# Altium schematic sheet BATTERYMONITORSchDoc.SchDoc
size 300 x 200 mm; SheetNumber: 3; SheetTotal: 4
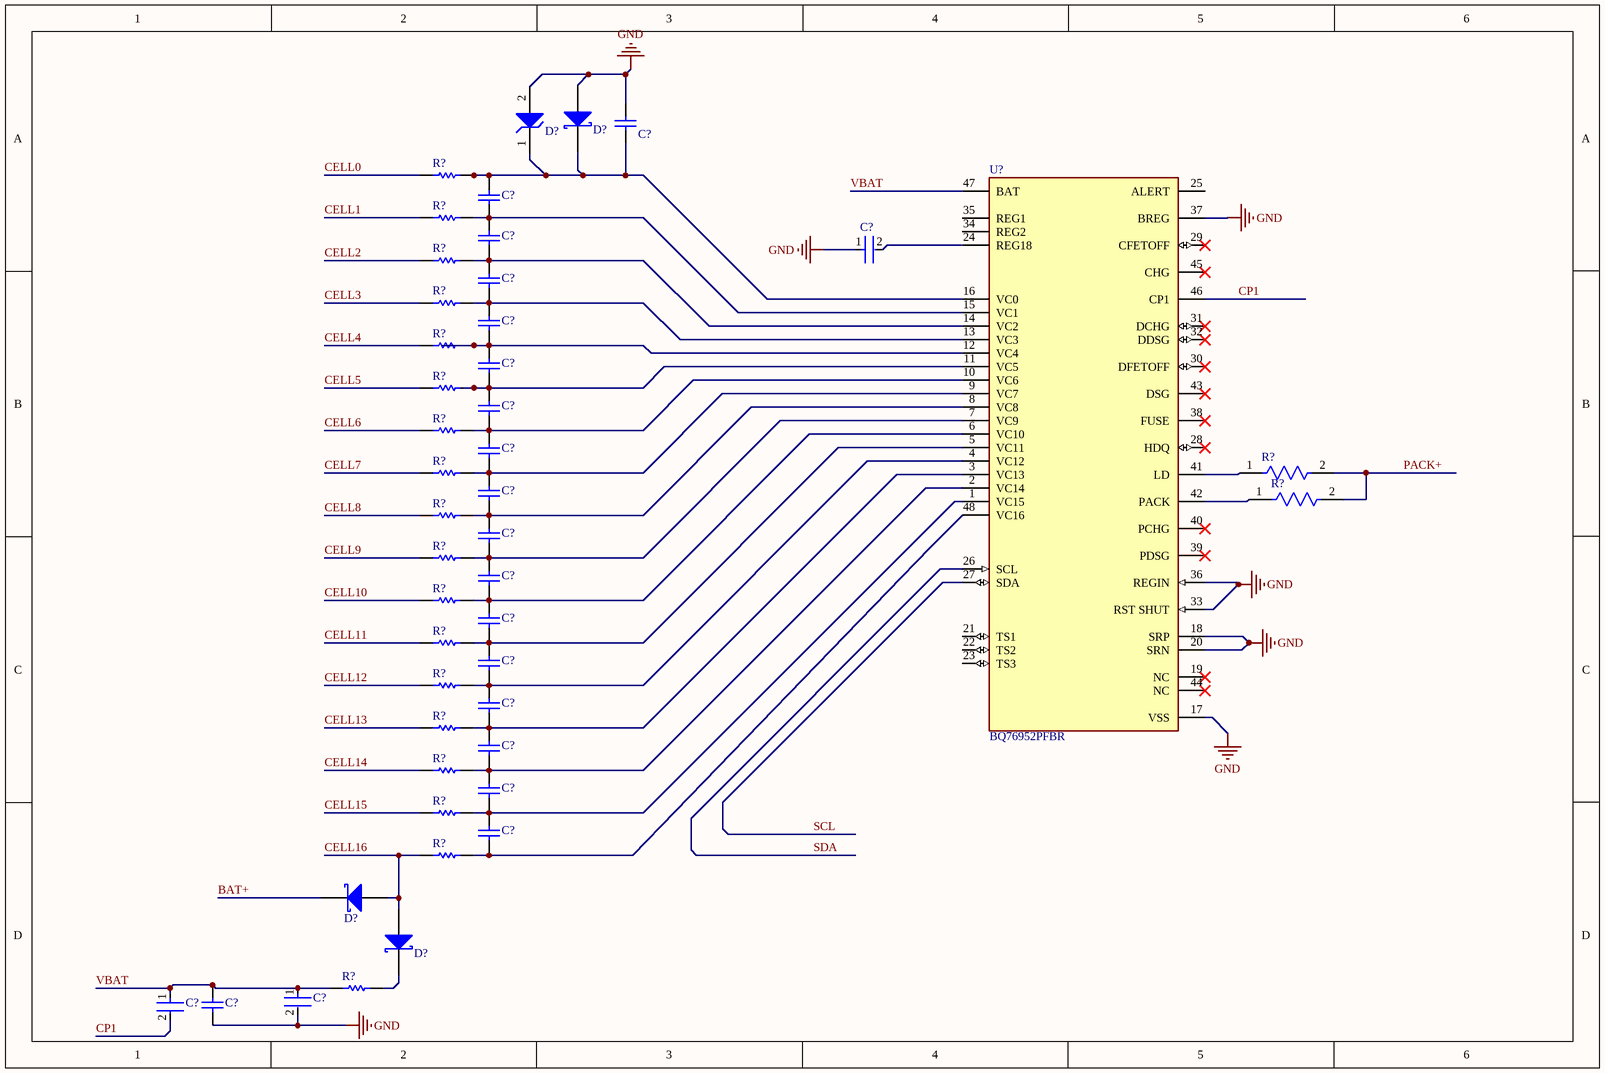
[diagram p0: BATTERYMONITORSchDoc.SchDoc]

## Parts
(Parts that share a designator on the sheet are numbered #1, #2 ... from top to bottom, then left to right.)
C?#1  06036C224KAT2A  [CAPC1608X90X35ML15T15]  (value not drawn)
C?#2  06036C224KAT2A  [CAPC1608X90X35ML15T15]  (value not drawn)
C?#3  06036C224KAT2A  [CAPC1608X90X35ML15T15]  (value not drawn)
C?#4  GRM155D80G225ME95D  [FP-GRM155-0_05-IPC_B]  (value not drawn)
C?#5  06036C224KAT2A  [CAPC1608X90X35ML15T15]  (value not drawn)
C?#6  06036C224KAT2A  [CAPC1608X90X35ML15T15]  (value not drawn)
C?#7  06036C224KAT2A  [CAPC1608X90X35ML15T15]  (value not drawn)
C?#8  06036C224KAT2A  [CAPC1608X90X35ML15T15]  (value not drawn)
C?#9  06036C224KAT2A  [CAPC1608X90X35ML15T15]  (value not drawn)
C?#10  06036C224KAT2A  [CAPC1608X90X35ML15T15]  (value not drawn)
C?#11  06036C224KAT2A  [CAPC1608X90X35ML15T15]  (value not drawn)
C?#12  06036C224KAT2A  [CAPC1608X90X35ML15T15]  (value not drawn)
C?#13  06036C224KAT2A  [CAPC1608X90X35ML15T15]  (value not drawn)
C?#14  06036C224KAT2A  [CAPC1608X90X35ML15T15]  (value not drawn)
C?#15  06036C224KAT2A  [CAPC1608X90X35ML15T15]  (value not drawn)
C?#16  06036C224KAT2A  [CAPC1608X90X35ML15T15]  (value not drawn)
C?#17  06036C224KAT2A  [CAPC1608X90X35ML15T15]  (value not drawn)
C?#18  06036C224KAT2A  [CAPC1608X90X35ML15T15]  (value not drawn)
C?#19  GRM21BC72A105KE01K  [FP-GRM21B-0_2-e0_2_0_7-MFG]  (value not drawn)
C?#20  GRM21BC72A105KE01K  [FP-GRM21B-0_2-e0_2_0_7-MFG]  (value not drawn)
C?#21  08051A101JAT4A  [CAPC2013X94X50ML20T25]  (value not drawn)
D?#1  BAT46W-7-F  [DIOD-SOD-123-2_V]  (value not drawn)
D?#2  MMSZ4685T1G  [ONSC-SOD-123-2-425-04_V]  (value not drawn)
D?#3  BAT46W-7-F  [DIOD-SOD-123-2_V]  (value not drawn)
D?#4  BAT46W-7-F  [DIOD-SOD-123-2_V]  (value not drawn)
R?#1  ERJ-P14J470U  [RESC3225X70X50NL20T20]  (value not drawn)
R?#2  ERJ-P14J470U  [RESC3225X70X50NL20T20]  (value not drawn)
R?#3  ERJ-P14J470U  [RESC3225X70X50NL20T20]  (value not drawn)
R?#4  ERJ-P14J470U  [RESC3225X70X50NL20T20]  (value not drawn)
R?#5  ERJ-P14J470U  [RESC3225X70X50NL20T20]  (value not drawn)
R?#6  ERJ-P14J470U  [RESC3225X70X50NL20T20]  (value not drawn)
R?#7  ERJ-P14J470U  [RESC3225X70X50NL20T20]  (value not drawn)
R?#8  ERJ-P14J470U  [RESC3225X70X50NL20T20]  (value not drawn)
R?#9  CRGP1206F10K  [FP-CRGP1206-IPC_C]  (value not drawn)
R?#10  ERJ-P14J470U  [RESC3225X70X50NL20T20]  (value not drawn)
R?#11  CRGP1206F10K  [FP-CRGP1206-IPC_C]  (value not drawn)
R?#12  ERJ-P14J470U  [RESC3225X70X50NL20T20]  (value not drawn)
R?#13  ERJ-P14J470U  [RESC3225X70X50NL20T20]  (value not drawn)
R?#14  ERJ-P14J470U  [RESC3225X70X50NL20T20]  (value not drawn)
R?#15  ERJ-P14J470U  [RESC3225X70X50NL20T20]  (value not drawn)
R?#16  ERJ-P14J470U  [RESC3225X70X50NL20T20]  (value not drawn)
R?#17  ERJ-P14J470U  [RESC3225X70X50NL20T20]  (value not drawn)
R?#18  ERJ-P14J470U  [RESC3225X70X50NL20T20]  (value not drawn)
R?#19  ERJ-P14J470U  [RESC3225X70X50NL20T20]  (value not drawn)
R?#20  ERJ-P14J470U  [RESC3225X70X50NL20T20]  (value not drawn)
U?  BQ76952PFBR  [FP-PFB0048A-IPC_B]

## Nets
GND: C?#1.1 C?#4.1 C?#19.2 C?#21.1 D?#1.1(A) D?#2.2(A) U?.17(VSS) U?.18(SRP) U?.20(SRN) U?.33(RST_SHUT) U?.36(REGIN) U?.37(BREG)
BAT+: D?#3.2(K)
CELL0: R?#1.1
CELL1: R?#2.1
CELL2: R?#3.1
CELL3: R?#4.1
CELL4: R?#5.1
CELL5: R?#6.1
CELL6: R?#7.1
CELL7: R?#8.1
CELL8: R?#10.1
CELL9: R?#12.1
CELL10: R?#13.1
CELL11: R?#14.1
CELL12: R?#15.1
CELL13: R?#16.1
CELL14: R?#17.1
CELL15: R?#18.1
CELL16: D?#3.1(A) D?#4.1(A) R?#19.1
CP1: C?#20.2 U?.46(CP1)
PACK+: R?#9.2 R?#11.2
SCL: U?.27(SDA)
SDA: U?.26(SCL)
VBAT: C?#19.1 C?#20.1 C?#21.2 R?#20.1 U?.47(BAT)
NetC?#1_2: C?#1.2 C?#2.2 D?#1.2(K) D?#2.1(K) R?#1.2 U?.16(VC0)
NetC?#2_1: C?#2.1 C?#3.2 R?#2.2 U?.15(VC1)
NetC?#3_1: C?#3.1 C?#5.2 R?#3.2 U?.14(VC2)
NetC?#4_2: C?#4.2 U?.24(REG18)
NetC?#5_1: C?#5.1 C?#6.2 R?#4.2 U?.13(VC3)
NetC?#6_1: C?#6.1 C?#7.2 R?#5.2 U?.12(VC4)
NetC?#7_1: C?#7.1 C?#8.2 R?#6.2 U?.11(VC5)
NetC?#8_1: C?#8.1 C?#9.2 R?#7.2 U?.10(VC6)
NetC?#9_1: C?#9.1 C?#10.2 R?#8.2 U?.9(VC7)
NetC?#10_1: C?#10.1 C?#11.2 R?#10.2 U?.8(VC8)
NetC?#11_1: C?#11.1 C?#12.2 R?#12.2 U?.7(VC9)
NetC?#12_1: C?#12.1 C?#13.2 R?#13.2 U?.6(VC10)
NetC?#13_1: C?#13.1 C?#14.2 R?#14.2 U?.5(VC11)
NetC?#14_1: C?#14.1 C?#15.2 R?#15.2 U?.4(VC12)
NetC?#15_1: C?#15.1 C?#16.2 R?#16.2 U?.3(VC13)
NetC?#16_1: C?#16.1 C?#17.2 R?#17.2 U?.2(VC14)
NetC?#17_1: C?#17.1 C?#18.2 R?#18.2 U?.1(VC15)
NetC?#18_1: C?#18.1 R?#19.2 U?.48(VC16)
NetD?#4_2: D?#4.2(K) R?#20.2
NetR?#9_1: R?#9.1 U?.41(LD)
NetR?#11_1: R?#11.1 U?.42(PACK)

Not connected (* = marked no-connect by the designer): U? 19(NC)* 21(TS1) 22(TS2) 23(TS3) 25(ALERT) 28(HDQ)* 29(CFETOFF)* 30(DFETOFF)* 31(DCHG)* 32(DDSG)* 34(REG2) 35(REG1) 38(FUSE)* 39(PDSG)* 40(PCHG)* 43(DSG)* 44(NC)* 45(CHG)*

## Library data of the parts
C?#1-C?#3 C?#5-C?#18 = CMP-2006-02108-1: Manufacturer: AVX Interconnect / Elco; Part Number: 06036C224KAT2A
C?#4 = CMP-06035-053442-1: Chip Multilayer Ceramic Capacitors for General Purpose, 0402, 2.2uF, X6T, +22%/-33%, 20%, 4V; Case Code (Metric): 1005; Depth: 0.5mm; Voltage Rating: 4V; Dielectric: X6T; Length: 1mm; Height: 0.5mm; Capacitance: 2.2uF; Packaging: Tape and Reel; Voltage: 4V; Case/Package: 0402; Max Operating Temperature: 105°C; Tolerance: 20%; Min Operating Temperature: -55°C; Thickness: 500um; Voltage Rating (DC): 4V; Case Code (Imperial): 0402; Mount: Surface Mount; REACH SVHC: No SVHC
C?#19 C?#20 = CMP-06035-022504-1: Chip Multilayer Ceramic Capacitors for General Purpose, 0805, 1.0uF, X7S, 22%, 10%, 100V; Capacitance: 1uF; Width: 1.25mm; Dielectric: X7S; Length: 2mm; Thickness: 1.25mm; Voltage Rating (DC): 100V; Tolerance: 10%
C?#21 = CMP-2007-04122-1: Manufacturer: AVX Interconnect / Elco; Part Number: 08051A101JAT4A
D?#1 D?#3 D?#4 = CMP-0303-00004-1: Surface Mount Schottky Barrier Diode, 100 V, -55 to 125 degC, 2-Pin SOD123, RoHS, Tape and Reel; Manufacturer: Diodes Inc; IR@1.5 V: 0.3 uA Max.; V(BR)R: 100 V Min.; VF@10 mA: 0.45 V Max.; CT@1 V: 12 pF Typ.; PartNumber: BAT46W-7-F; ComponentLink1URL: http://www.diodes.com/; ComponentLink3URL: http://diodes.com/datasheets/ds30044.pdf; PackageDescription: 2-Pin SMD, Body 2.7 x 1.55 mm, Height 1.45 mm; ComponentLink2Description: Datasheet; ComponentLink3Description: Package Specification; Mounting Technology: Surface Mount; ComponentLink1Description: Manufacturer URL; RoHS: TRUE; Operating Temperature: -55 to 125 degC; Packing: Tape and Reel; ComponentLink2URL: http://diodes.com/datasheets/ds30044.pdf; DatasheetVersion: Rev. 16-2
D?#2 = CMP-1060-00574-1: Zener Voltage Regulator, 500 mW, 2-Pin SOD-123, Pb-Free, Tape and Reel; Manufacturer: On Semiconductor; VZ Typ (V): 3.6; P Max (W): 0.5; DatasheetVersion: Rev. 9; ComponentLink2Description: Datasheet; Mounting Technology: Surface Mount; ComponentLink3URL: http://www.onsemi.com/pub_link/Collateral/425-04.PDF; ComponentLink3Description: Package Specification; RoHS: Pb-Free; PartNumber: MMSZ4685T1G; ComponentLink1URL: http://www.onsemi.com/; PackageDescription: 2-Pin SOD, Body 1.6 x 2.69 mm; ComponentLink2URL: http://www.onsemi.com/pub_link/Collateral/MMSZ4678T1-D.PDF; ComponentLink1Description: Manufacturer URL; Packing: Tape and Reel; PackageVersion: Rev. G, 10/2009; PackageReference: SOD-123-2-425-04
R?#1-R?#8 R?#10 R?#12-R?#20 = CMP-2005-03736-1: Manufacturer: Panasonic; Part Number: ERJ-P14J470U
R?#9 R?#11 = CMP-03211-004788-1: CRGP 1206 10K 1%; Manufacturer: TE; Temperature Coefficient: ±100ppm/°C; Resistance: 10KΩ; Value: 10KΩ; Tolerance: 0.01; Power Rating: 0.5W; Voltage Rating: 200V; Package: CRGP1206; Ambient Temperature Range High: +70°C; Device Class L2: Resistors; Lead Free: Yes; Automotive: No; Series: CRGP; Temperature Range High: +155°C; Ipc Land Pattern Name: RESC310155X55; Device Class L1: Passive Components; Octopart: https://octopart.com/crgp1206f10k-te+connectivity-91018843; Temperature: -55°C to +155°C; Category: Res; Height: 0.65mm; Temperature Range Low: -55°C; RoHS: TRUE; Manufacturer Part Number: CRGP1206F10K; Digikey Description: CRGP 1206 10K 1%; Device Class L3: Chip SMD Resistors; Composition: Thick Film; ComponentLink2URL: https://www.mouser.com/datasheet/2/418/NG_DS_9-1773463-9_A-1358566.pdf; ComponentLink2Description: Datasheet
U? = CMP-04911-000082-1: IC BAT LIFEPO4/LI-ION 3-16C TQFP; RoHS Compliant: Yes